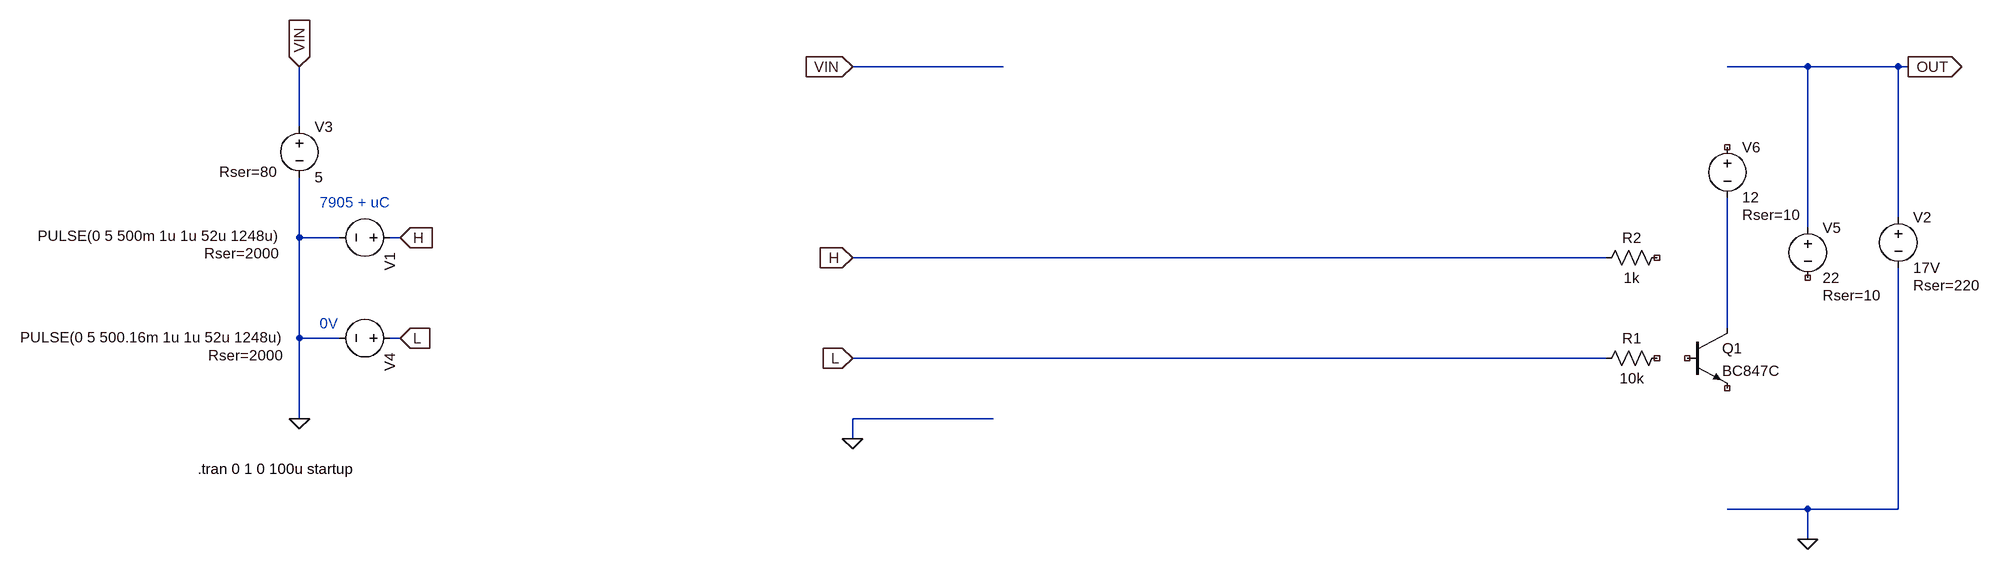
[diagram p0: schematic DriverB2.asc]
DriverB2.asc, the LTspice schematic file:
Version 4
SHEET 1 1772 804
WIRE 208 16 -32 16
WIRE 1488 16 1360 16
WIRE 1632 16 1488 16
WIRE 1648 16 1632 16
WIRE -912 112 -912 16
WIRE 1632 256 1632 16
WIRE 1488 272 1488 16
WIRE -912 288 -912 192
WIRE -848 288 -912 288
WIRE -752 288 -768 288
WIRE 1168 320 -32 320
WIRE 1360 432 1360 224
WIRE -912 448 -912 288
WIRE -848 448 -912 448
WIRE -752 448 -768 448
WIRE 1168 480 -32 480
WIRE -912 576 -912 448
WIRE 192 576 -32 576
WIRE -32 608 -32 576
WIRE 1488 720 1360 720
WIRE 1632 720 1632 336
WIRE 1632 720 1488 720
WIRE 1488 768 1488 720
FLAG 1648 16 OUT
IOPIN 1648 16 Out
FLAG -32 320 H
IOPIN -32 320 In
FLAG -32 480 L
IOPIN -32 480 In
FLAG -752 288 H
IOPIN -752 288 In
FLAG -752 448 L
IOPIN -752 448 In
FLAG -32 16 VIN
IOPIN -32 16 In
FLAG -912 16 VIN
IOPIN -912 16 In
FLAG 1488 768 0
FLAG -912 576 0
FLAG -32 608 0
SYMBOL voltage -752 288 R90
WINDOW 3 -3 192 VRight 2
WINDOW 123 0 0 Left 0
WINDOW 39 25 192 VRight 2
SYMATTR InstName V1
SYMATTR Value PULSE(0 5 500m 1u 1u 52u 1248u)
SYMATTR SpiceLine Rser=2000
SYMBOL voltage -912 96 R0
WINDOW 123 0 0 Left 0
WINDOW 39 -128 87 Left 2
SYMATTR InstName V3
SYMATTR Value 5
SYMATTR SpiceLine Rser=80
SYMBOL voltage -752 448 R90
WINDOW 3 -1 186 VRight 2
WINDOW 123 0 0 Left 0
WINDOW 39 27 186 VRight 2
SYMATTR InstName V4
SYMATTR Value PULSE(0 5 500.16m 1u 1u 52u 1248u)
SYMATTR SpiceLine Rser=2000
SYMBOL voltage 1632 240 R0
WINDOW 123 0 0 Left 0
WINDOW 39 24 124 Left 2
SYMATTR InstName V2
SYMATTR Value 17V
SYMATTR SpiceLine Rser=220
SYMBOL voltage 1488 256 R0
WINDOW 123 0 0 Left 0
WINDOW 39 24 124 Left 2
SYMATTR InstName V5
SYMATTR Value 22
SYMATTR SpiceLine Rser=10
SYMBOL voltage 1360 128 R0
WINDOW 123 0 0 Left 0
WINDOW 39 24 124 Left 2
SYMATTR InstName V6
SYMATTR Value 12
SYMATTR SpiceLine Rser=10
SYMBOL npn 1296 432 R0
SYMATTR InstName Q1
SYMATTR Value BC847C
SYMBOL res 1264 464 R90
WINDOW 0 0 56 VBottom 2
WINDOW 3 32 56 VTop 2
SYMATTR InstName R1
SYMATTR Value 10k
SYMBOL res 1264 304 R90
WINDOW 0 0 56 VBottom 2
WINDOW 3 32 56 VTop 2
SYMATTR InstName R2
SYMATTR Value 1k
TEXT -1074 656 Left 2 !.tran 0 1 0 100u startup
TEXT -880 232 Left 2 ;7905 + uC
TEXT -880 424 Left 2 ;0V

The netlist it stands for:
* DriverB2.asc
V1 H 0 PULSE(0 5 500m 1u 1u 52u 1248u) Rser=2000
V3 VIN 0 5 Rser=80
V4 L 0 PULSE(0 5 500.16m 1u 1u 52u 1248u) Rser=2000
V2 OUT 0 17V Rser=220
V5 OUT NC_01 22 Rser=10
V6 NC_02 N001 12 Rser=10
Q1 N001 NC_03 NC_04 0 BC847C
R1 NC_05 L 10k
R2 NC_06 H 1k
.model NPN NPN
.model PNP PNP
.lib standard.bjt
.tran 0 1 0 100u startup
* 7905 + uC
* 0V
.backanno
.end